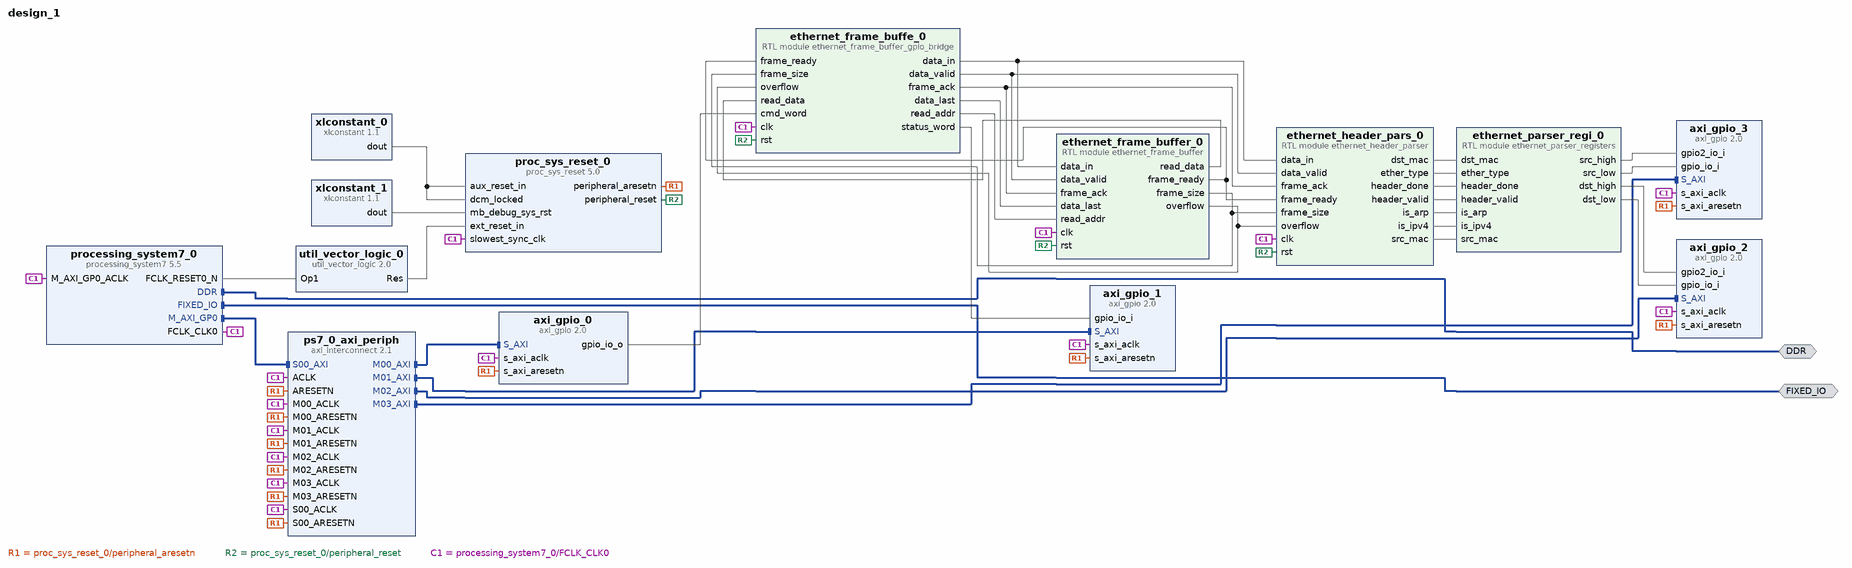
[diagram p0: block diagram of the top level]
# Vivado block design design_1, xc7z020clg400-1, Vivado 2024.1
create_bd_design design_1

create_bd_intf_port -mode Master -vlnv xilinx.com:interface:ddrx_rtl:1.0 DDR
create_bd_intf_port -mode Master -vlnv xilinx.com:display_processing_system7:fixedio_rtl:1.0 FIXED_IO

create_bd_cell -type ip -vlnv xilinx.com:ip:processing_system7:5.5 processing_system7_0
# 1 more settings of processing_system7_0 are not shown: defaults, MIO pin electricals, DDR timing, and values the tool derives
create_bd_cell -type ip -vlnv xilinx.com:ip:proc_sys_reset:5.0 proc_sys_reset_0
create_bd_cell -type ip -vlnv xilinx.com:ip:xlconstant:1.1 xlconstant_0
create_bd_cell -type ip -vlnv xilinx.com:ip:util_vector_logic:2.0 util_vector_logic_0
set_property -dict {CONFIG.C_OPERATION not CONFIG.C_SIZE 1} [get_bd_cells util_vector_logic_0]
create_bd_cell -type ip -vlnv xilinx.com:ip:xlconstant:1.1 xlconstant_1
set_property -dict {CONFIG.CONST_VAL 0} [get_bd_cells xlconstant_1]
create_bd_cell -type module -reference ethernet_frame_buffer ethernet_frame_buffer_0
create_bd_cell -type ip -vlnv xilinx.com:ip:axi_gpio:2.0 axi_gpio_0
set_property -dict {CONFIG.C_ALL_OUTPUTS 1} [get_bd_cells axi_gpio_0]
create_bd_cell -type ip -vlnv xilinx.com:ip:axi_interconnect:2.1 ps7_0_axi_periph
set_property -dict {CONFIG.NUM_MI 4} [get_bd_cells ps7_0_axi_periph]
create_bd_cell -type ip -vlnv xilinx.com:ip:axi_gpio:2.0 axi_gpio_1
set_property -dict {CONFIG.C_ALL_INPUTS 1} [get_bd_cells axi_gpio_1]
create_bd_cell -type module -reference ethernet_frame_buffer_gpio_bridge ethernet_frame_buffe_0
create_bd_cell -type module -reference ethernet_header_parser ethernet_header_pars_0
create_bd_cell -type ip -vlnv xilinx.com:ip:axi_gpio:2.0 axi_gpio_2
set_property -dict {CONFIG.C_ALL_INPUTS 1 CONFIG.C_ALL_INPUTS_2 1 CONFIG.C_IS_DUAL 1} [get_bd_cells axi_gpio_2]
create_bd_cell -type ip -vlnv xilinx.com:ip:axi_gpio:2.0 axi_gpio_3
set_property -dict {CONFIG.C_ALL_INPUTS 1 CONFIG.C_ALL_INPUTS_2 1 CONFIG.C_IS_DUAL 1} [get_bd_cells axi_gpio_3]
create_bd_cell -type module -reference ethernet_parser_registers ethernet_parser_regi_0

# ---- connections ----

connect_bd_intf_net [get_bd_intf_ports DDR] [get_bd_intf_pins processing_system7_0/DDR]
connect_bd_intf_net [get_bd_intf_ports FIXED_IO] [get_bd_intf_pins processing_system7_0/FIXED_IO]
connect_bd_intf_net [get_bd_intf_pins processing_system7_0/M_AXI_GP0] [get_bd_intf_pins ps7_0_axi_periph/S00_AXI]
connect_bd_intf_net [get_bd_intf_pins ps7_0_axi_periph/M00_AXI] [get_bd_intf_pins axi_gpio_0/S_AXI]
connect_bd_intf_net [get_bd_intf_pins ps7_0_axi_periph/M01_AXI] [get_bd_intf_pins axi_gpio_1/S_AXI]
connect_bd_intf_net [get_bd_intf_pins ps7_0_axi_periph/M02_AXI] [get_bd_intf_pins axi_gpio_2/S_AXI]
connect_bd_intf_net [get_bd_intf_pins ps7_0_axi_periph/M03_AXI] [get_bd_intf_pins axi_gpio_3/S_AXI]
connect_bd_net [get_bd_pins axi_gpio_0/gpio_io_o] [get_bd_pins ethernet_frame_buffe_0/cmd_word]
connect_bd_net [get_bd_pins ethernet_frame_buffe_0/data_in] [get_bd_pins ethernet_frame_buffer_0/data_in] [get_bd_pins ethernet_header_pars_0/data_in]
connect_bd_net [get_bd_pins ethernet_frame_buffe_0/data_last] [get_bd_pins ethernet_frame_buffer_0/data_last]
connect_bd_net [get_bd_pins ethernet_frame_buffe_0/data_valid] \
  [get_bd_pins ethernet_frame_buffer_0/data_valid] [get_bd_pins ethernet_header_pars_0/data_valid]
connect_bd_net [get_bd_pins ethernet_frame_buffe_0/frame_ack] \
  [get_bd_pins ethernet_frame_buffer_0/frame_ack] [get_bd_pins ethernet_header_pars_0/frame_ack]
connect_bd_net [get_bd_pins ethernet_frame_buffe_0/read_addr] [get_bd_pins ethernet_frame_buffer_0/read_addr]
connect_bd_net [get_bd_pins ethernet_frame_buffe_0/status_word] [get_bd_pins axi_gpio_1/gpio_io_i]
connect_bd_net [get_bd_pins ethernet_frame_buffer_0/frame_ready] \
  [get_bd_pins ethernet_frame_buffe_0/frame_ready] [get_bd_pins ethernet_header_pars_0/frame_ready]
connect_bd_net [get_bd_pins ethernet_frame_buffer_0/frame_size] \
  [get_bd_pins ethernet_frame_buffe_0/frame_size] [get_bd_pins ethernet_header_pars_0/frame_size]
connect_bd_net [get_bd_pins ethernet_frame_buffer_0/overflow] \
  [get_bd_pins ethernet_frame_buffe_0/overflow] [get_bd_pins ethernet_header_pars_0/overflow]
connect_bd_net [get_bd_pins ethernet_frame_buffer_0/read_data] [get_bd_pins ethernet_frame_buffe_0/read_data]
connect_bd_net [get_bd_pins ethernet_header_pars_0/dst_mac] [get_bd_pins ethernet_parser_regi_0/dst_mac]
connect_bd_net [get_bd_pins ethernet_header_pars_0/ether_type] [get_bd_pins ethernet_parser_regi_0/ether_type]
connect_bd_net [get_bd_pins ethernet_header_pars_0/header_done] [get_bd_pins ethernet_parser_regi_0/header_done]
connect_bd_net [get_bd_pins ethernet_header_pars_0/header_valid] [get_bd_pins ethernet_parser_regi_0/header_valid]
connect_bd_net [get_bd_pins ethernet_header_pars_0/is_arp] [get_bd_pins ethernet_parser_regi_0/is_arp]
connect_bd_net [get_bd_pins ethernet_header_pars_0/is_ipv4] [get_bd_pins ethernet_parser_regi_0/is_ipv4]
connect_bd_net [get_bd_pins ethernet_header_pars_0/src_mac] [get_bd_pins ethernet_parser_regi_0/src_mac]
connect_bd_net [get_bd_pins ethernet_parser_regi_0/dst_high] [get_bd_pins axi_gpio_2/gpio2_io_i]
connect_bd_net [get_bd_pins ethernet_parser_regi_0/dst_low] [get_bd_pins axi_gpio_2/gpio_io_i]
connect_bd_net [get_bd_pins ethernet_parser_regi_0/src_high] [get_bd_pins axi_gpio_3/gpio2_io_i]
connect_bd_net [get_bd_pins ethernet_parser_regi_0/src_low] [get_bd_pins axi_gpio_3/gpio_io_i]
connect_bd_net [get_bd_pins proc_sys_reset_0/peripheral_aresetn] \
  [get_bd_pins ps7_0_axi_periph/S00_ARESETN] [get_bd_pins axi_gpio_0/s_axi_aresetn] \
  [get_bd_pins ps7_0_axi_periph/M00_ARESETN] [get_bd_pins ps7_0_axi_periph/ARESETN] [get_bd_pins axi_gpio_1/s_axi_aresetn] \
  [get_bd_pins ps7_0_axi_periph/M01_ARESETN] [get_bd_pins axi_gpio_2/s_axi_aresetn] \
  [get_bd_pins ps7_0_axi_periph/M02_ARESETN] [get_bd_pins axi_gpio_3/s_axi_aresetn] \
  [get_bd_pins ps7_0_axi_periph/M03_ARESETN]
connect_bd_net [get_bd_pins proc_sys_reset_0/peripheral_reset] \
  [get_bd_pins ethernet_frame_buffer_0/rst] [get_bd_pins ethernet_frame_buffe_0/rst] [get_bd_pins ethernet_header_pars_0/rst]
connect_bd_net [get_bd_pins processing_system7_0/FCLK_CLK0] \
  [get_bd_pins proc_sys_reset_0/slowest_sync_clk] [get_bd_pins processing_system7_0/M_AXI_GP0_ACLK] \
  [get_bd_pins ethernet_frame_buffer_0/clk] [get_bd_pins ps7_0_axi_periph/S00_ACLK] [get_bd_pins axi_gpio_0/s_axi_aclk] \
  [get_bd_pins ps7_0_axi_periph/M00_ACLK] [get_bd_pins ps7_0_axi_periph/ACLK] [get_bd_pins axi_gpio_1/s_axi_aclk] \
  [get_bd_pins ps7_0_axi_periph/M01_ACLK] [get_bd_pins ethernet_frame_buffe_0/clk] [get_bd_pins ethernet_header_pars_0/clk] \
  [get_bd_pins axi_gpio_2/s_axi_aclk] [get_bd_pins ps7_0_axi_periph/M02_ACLK] [get_bd_pins axi_gpio_3/s_axi_aclk] \
  [get_bd_pins ps7_0_axi_periph/M03_ACLK]
connect_bd_net [get_bd_pins processing_system7_0/FCLK_RESET0_N] [get_bd_pins util_vector_logic_0/Op1]
connect_bd_net [get_bd_pins util_vector_logic_0/Res] [get_bd_pins proc_sys_reset_0/ext_reset_in]
connect_bd_net [get_bd_pins xlconstant_0/dout] [get_bd_pins proc_sys_reset_0/dcm_locked] [get_bd_pins proc_sys_reset_0/aux_reset_in]
connect_bd_net [get_bd_pins xlconstant_1/dout] [get_bd_pins proc_sys_reset_0/mb_debug_sys_rst]

# ---- address map ----
assign_bd_address -offset 0x41200000 -range 64K -target_address_space [get_bd_addr_spaces processing_system7_0/Data] [get_bd_addr_segs axi_gpio_0/S_AXI/Reg]
assign_bd_address -offset 0x41210000 -range 64K -target_address_space [get_bd_addr_spaces processing_system7_0/Data] [get_bd_addr_segs axi_gpio_1/S_AXI/Reg]
assign_bd_address -offset 0x41220000 -range 64K -target_address_space [get_bd_addr_spaces processing_system7_0/Data] [get_bd_addr_segs axi_gpio_2/S_AXI/Reg]
assign_bd_address -offset 0x41230000 -range 64K -target_address_space [get_bd_addr_spaces processing_system7_0/Data] [get_bd_addr_segs axi_gpio_3/S_AXI/Reg]

validate_bd_design
save_bd_design
